# Altium schematic sheet Motor1.SchDoc
size A4; SheetNumber: 5; SheetTotal: 6
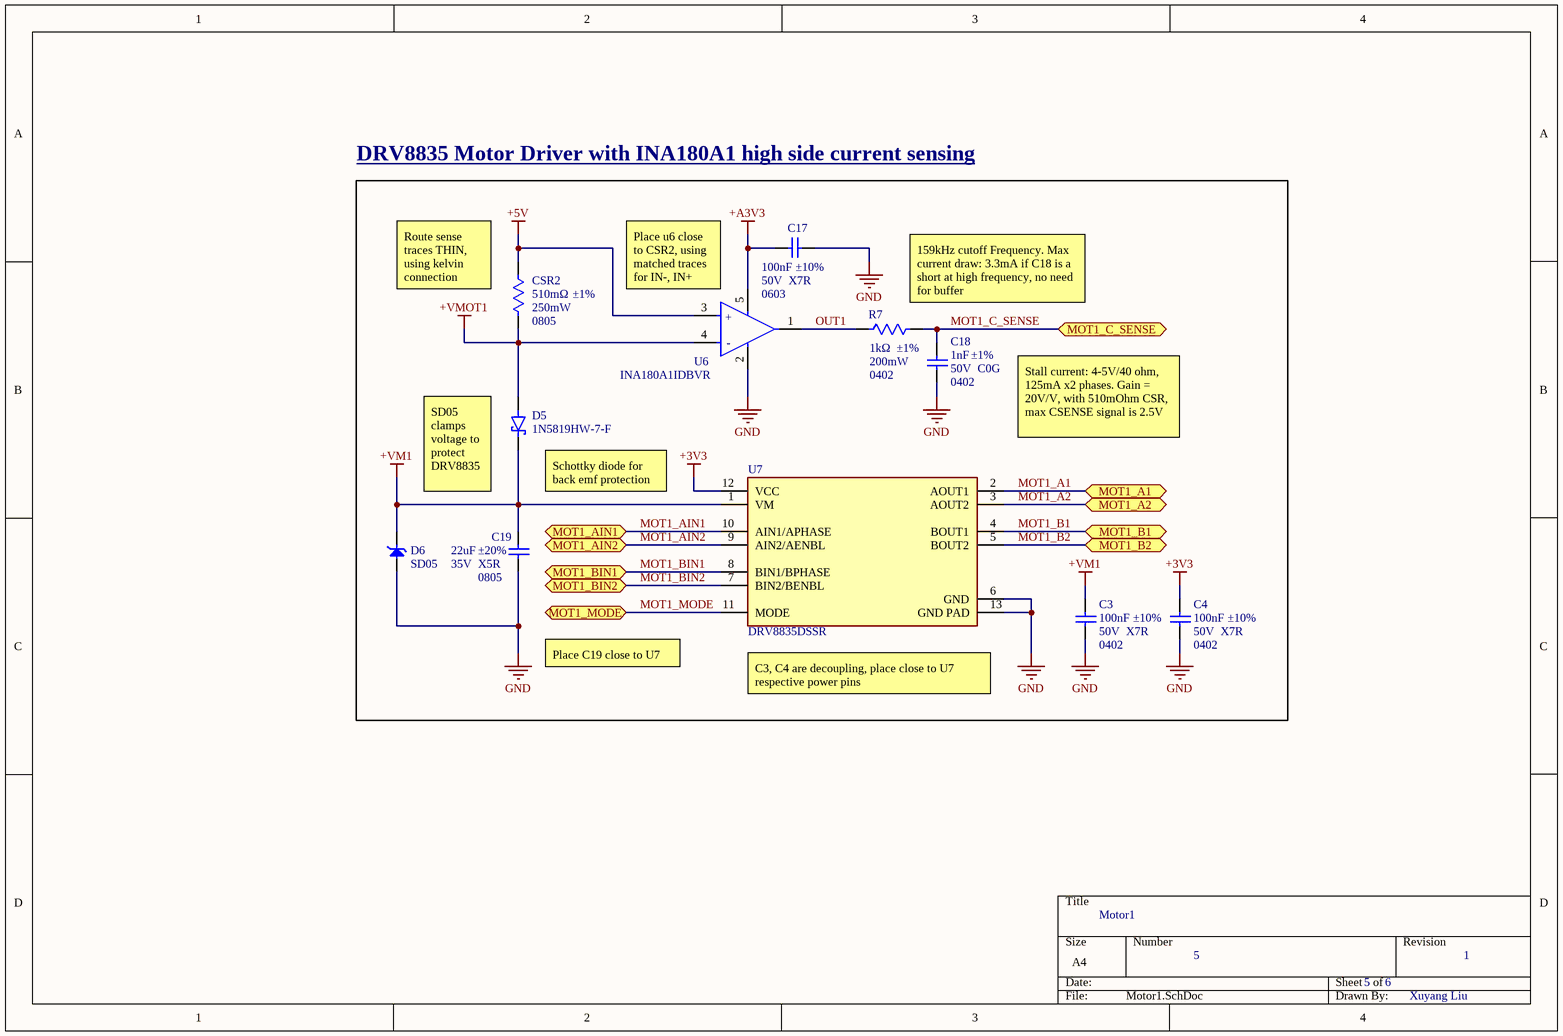
[diagram p0: Motor1.SchDoc]

## Parts
C3  Case/Package: 0402  Voltage Rating: 50V  Dielectric: X7R  Tolerance: ±10%  [0402_Cap]  (hidden comment: 100nF)
C4  Case/Package: 0402  Voltage Rating: 50V  Dielectric: X7R  Tolerance: ±10%  [0402_Cap]  (hidden comment: 100nF)
C17  Voltage Rating: 50V  Tolerance: ±10%  Dielectric: X7R  Case/Package: 0603  [0603_CAP]  (hidden comment: 100nF)
C18  Tolerance: ±1%  Voltage Rating: 50V  Dielectric: C0G  Case/Package: 0402  [0402_Cap]  (hidden comment: 1nF)
C19  22uF  Dielectric: X5R  Case/Package: 0805  Tolerance: ±20%  Voltage Rating: 35V  [0805_CAP]
CSR2  Case/Package: 0805  Tolerance: ±1%  Resistance: 510mΩ  Power Rating: 250mW  [0805_VIS-M]  (hidden comment: 0.5R)
D5  1N5819HW-7-F  [FP-SOD123-MFG]
D6  SD05  [DIO_MM3Z3V0T1G]
R7  Power Rating: 200mW  Tolerance: ±1%  Case/Package: 0402  Resistance: 1kΩ  [0402_RES]  (hidden comment: 1K)
U6  INA180A1IDBVR  [FP-DBV0005A-MFG]
U7  DRV8835DSSR  [FP-DSS0012A-MFG]

## Blocks framed on the sheet
DRV8835 Motor Driver with INA180A1 high side current sensing: C3 C4 C17-C19 CSR2 D5 D6 R7 U6 U7

## Ports
MOT1_A1 (bidir), MOT1_A2 (bidir), MOT1_AIN1 (bidir), MOT1_AIN2 (bidir), MOT1_B1 (bidir), MOT1_B2 (bidir), MOT1_BIN1 (bidir), MOT1_BIN2 (bidir), MOT1_C_SENSE (bidir), MOT1_MODE (bidir)

## Nets
+3V3: C4.2 U7.12(VCC)
+5V: CSR2.2 U6.3(IN+)
+A3V3: C17.2 U6.5(VS)
+VM1: C3.2 C19.2 D5.C D6.K U7.1(VM)
+VMOT1: CSR2.1 D5.A U6.4(IN-)
GND: C3.1 C4.1 C17.1 C18.1 C19.1 D6.A U6.2(GND) U7.6(GND) U7.13(GND_PAD)
MOT1_A1: U7.2(AOUT1) ; port MOT1_A1
MOT1_A2: U7.3(AOUT2) ; port MOT1_A2
MOT1_AIN1: U7.10(AIN1/APHASE) ; port MOT1_AIN1
MOT1_AIN2: U7.9(AIN2/AENBL) ; port MOT1_AIN2
MOT1_B1: U7.4(BOUT1) ; port MOT1_B1
MOT1_B2: U7.5(BOUT2) ; port MOT1_B2
MOT1_BIN1: U7.8(BIN1/BPHASE) ; port MOT1_BIN1
MOT1_BIN2: U7.7(BIN2/BENBL) ; port MOT1_BIN2
MOT1_C_SENSE: C18.2 R7.2 ; port MOT1_C_SENSE
MOT1_MODE: U7.11(MODE) ; port MOT1_MODE
OUT1: R7.1 U6.1(OUT)

## Notes on the sheet
- (near CSR2) Route sense traces THIN, using kelvin connection
- (near U6) Place u6 close to CSR2, using matched traces for IN-, IN+
- (near R7) 159kHz cutoff Frequency. Max current draw: 3.3mA if C18 is a short at high frequency, no need for buffer
- Stall current: 4-5V/40 ohm, 125mA x2 phases. Gain = 20V/V, with 510mOhm CSR, max CSENSE signal is 2.5V
- (near D5) SD05 clamps voltage to protect DRV8835
- (near D5) Schottky diode for back emf protection
- Place C19 close to U7
- (near U7) C3, C4 are decoupling, place close to U7 respective power pins
- Motor1
- 5
- 5     6
- 1
- Xuyang Liu
- (in symbol INA180A1IDBVR) +; -

## Library data of the parts
C3 C4 = GCM155R71H104KE02J: 50V 100nF X7R ±10% 0402 Multilayer Ceramic Capacitors MLCC - SMD/SMT ROHS; Manufacturer: Murata; Manufacturer Lifecycle Status: IN PRODUCTION; Supplier 1: DigiKey; Manufacturer Part Number: GCM155R71H104KE02J; RoHS: Compliant; Category: Ceramic Capacitors; Stock 1: 13930662; Pricing 1: 1=0.1, 10=0.034, 50=0.0226, 100=0.0193, 500=0.01374, 1000=0.01205, 2500=0.01027, 5000=0.0092 (USD); Case Code (Imperial): 0402; Case Code (Metric): 1005; Country of Origin: Philippines; Dielectric Material: Ceramic; Export Control Classification Number (ECCN) Code: EAR99; Height: 500µm; Harmonized Tariff Schedule (HTS) Code: 8532.24.00.20; Introduction Date: 2013-11-20; Length: 1mm; Lifecycle Status: Production; Material: Ceramic; Max Operating Temperature: 125°C; Min Operating Temperature: -55°C; Mount: Surface Mount; Number of Terminals: 2; Packaging: Tape & Reel (TR); Ratings: AEC-Q200; REACH SVHC: Yes; Schedule B: 8532240020, 8532240020|8532240020, 8532240020|8532240020|8532240020, 8532240020|8532240020|8532240020|8532240020; Termination: SMD/SMT; Voltage Rating (DC): 50V; Weight: 6.010099mg; Width: 500µm; ComponentLink1URL: https://datasheet.octopart.com:443/GCM155R71H104KE02J-Murata-datasheet-155345015.pdf?src-supplier=Newark; ComponentLink1Description: https://datasheet.octopart.com:443/GCM155R71H104KE02J-Murata-datasheet-155345015.pdf?src-supplier=Newark; ComponentLink2URL: https://datasheet.octopart.com:443/GCM155R71H104KE02J-Murata-datasheet-178519985.pdf?src-supplier=Arrow.cn; ComponentLink2Description: https://datasheet.octopart.com:443/GCM155R71H104KE02J-Murata-datasheet-178519985.pdf?src-supplier=Arrow.cn; ComponentLink3URL: https://datasheet.octopart.com:443/GCM155R71H104KE02J-Murata-datasheet-141266224.pdf?src-supplier=Ciiva; ComponentLink3Description: https://datasheet.octopart.com:443/GCM155R71H104KE02J-Murata-datasheet-141266224.pdf?src-supplier=Ciiva; ComponentLink4URL: https://datasheet.octopart.com:443/GCM155R71H104KE02J-Murata-datasheet-140656751.pdf?src-supplier=Ciiva; ComponentLink4Description: https://datasheet.octopart.com:443/GCM155R71H104KE02J-Murata-datasheet-140656751.pdf?src-supplier=Ciiva; ComponentLink5URL: https://datasheet.octopart.com:443/GCM155R71H104KE02J-Murata-datasheet-138716456.pdf?src-supplier=Ciiva; ComponentLink5Description: https://datasheet.octopart.com:443/GCM155R71H104KE02J-Murata-datasheet-138716456.pdf?src-supplier=Ciiva; ComponentLink6URL: https://datasheet.octopart.com:443/GCM155R71H104KE02J-Murata-datasheet-77992203.pdf?src-supplier=Future+Electronics; ComponentLink6Description: https://datasheet.octopart.com:443/GCM155R71H104KE02J-Murata-datasheet-77992203.pdf?src-supplier=Future+Electronics; ComponentLink7URL: https://datasheet.octopart.com:443/GCM155R71H104KE02J-Murata-datasheet-12511495.pdf?src-supplier=TME; ComponentLink7Description: https://datasheet.octopart.com:443/GCM155R71H104KE02J-Murata-datasheet-12511495.pdf?src-supplier=TME; ComponentLink8URL: http://sigma.octopart.com:80/reach_statement/Murata-company-16.pdf?src-supplier=Compliance+Statements; ComponentLink8Description: http://sigma.octopart.com:80/reach_statement/Murata-company-16.pdf?src-supplier=Compliance+Statements; Supplier Part Number 1: 490-14514-6-ND; Capacitance: 100nF
C17 = GCJ188R71H104KA12D: 50V 100nF X7R ±10% 0603 Multilayer Ceramic Capacitors MLCC - SMD/SMT ROHS; Manufacturer: Murata; Manufacturer Lifecycle Status: IN PRODUCTION; Manufacturer Part Number: GCJ188R71H104KA12D; RoHS: Compliant; Category: Ceramic Capacitors; Stock 1: 938408; Pricing 1: 1=0.13, 10=0.073, 50=0.0508, 100=0.044, 500=0.0327, 1000=0.02922 (USD); Case Code (Imperial): 0603; Case Code (Metric): 1608; Country of Origin: Japan, Philippines; Depth: 800µm; Dielectric Material: Ceramic; Export Control Classification Number (ECCN) Code: EAR99; Features: Soft Termination; Height: 800µm; Harmonized Tariff Schedule (HTS) Code: 8532.24.00.20; Introduction Date: 2012-05-07; Lead Free: Lead Free; Length: 1.6mm; Lifecycle Status: Production; Material: Ceramic; Max Operating Temperature: 125°C; Min Operating Temperature: -55°C; Mount: Surface Mount; Number of Terminals: 2; Packaging: Cut Tape; Radiation Hardening: No; Ratings: AEC-Q200; REACH SVHC: Yes; Schedule B: 8532240020, 8532240020|8532240020, 8532240020|8532240020|8532240020, 8532240020|8532240020|8532240020|8532240020; Termination: SMD/SMT; Voltage Rating (DC): 50V; Width: 800µm; ComponentLink1URL: https://datasheet.octopart.com:443/GCJ188R71H104KA12D-Murata-datasheet-68586835.pdf?src-supplier=Newark; ComponentLink1Description: https://datasheet.octopart.com:443/GCJ188R71H104KA12D-Murata-datasheet-68586835.pdf?src-supplier=Newark; ComponentLink2URL: https://datasheet.octopart.com:443/GCJ188R71H104KA12D-Murata-datasheet-140654765.pdf?src-supplier=Ciiva; ComponentLink2Description: https://datasheet.octopart.com:443/GCJ188R71H104KA12D-Murata-datasheet-140654765.pdf?src-supplier=Ciiva; ComponentLink3URL: https://datasheet.octopart.com:443/GCJ188R71H104KA12D-Murata-datasheet-138714437.pdf?src-supplier=Ciiva; ComponentLink3Description: https://datasheet.octopart.com:443/GCJ188R71H104KA12D-Murata-datasheet-138714437.pdf?src-supplier=Ciiva; ComponentLink4URL: https://datasheet.octopart.com:443/GCJ188R71H104KA12D-Murata-datasheet-165611796.pdf?src-supplier=TME; ComponentLink4Description: https://datasheet.octopart.com:443/GCJ188R71H104KA12D-Murata-datasheet-165611796.pdf?src-supplier=TME; ComponentLink5URL: https://datasheet.octopart.com:443/GCJ188R71H104KA12D-Murata-datasheet-12524712.pdf?src-supplier=Future+Electronics; ComponentLink5Description: https://datasheet.octopart.com:443/GCJ188R71H104KA12D-Murata-datasheet-12524712.pdf?src-supplier=Future+Electronics; ComponentLink6URL: https://datasheet.octopart.com/GCJ188R71H104KA12D-Murata-datasheet-14405607.pdf; ComponentLink6Description: https://datasheet.octopart.com/GCJ188R71H104KA12D-Murata-datasheet-14405607.pdf; ComponentLink7URL: http://sigma.octopart.com:80/reach_statement/Murata-company-16.pdf?src-supplier=Compliance+Statements; ComponentLink7Description: http://sigma.octopart.com:80/reach_statement/Murata-company-16.pdf?src-supplier=Compliance+Statements; Supplier 1: DigiKey; Supplier Part Number 1: 490-5798-1-ND; Capacitance: 100nF
C18 = GCM1555C1H102FA16D: 50V 1nF C0G ±1% 0402 Multilayer Ceramic Capacitors MLCC - SMD/SMT ROHS; Manufacturer: Murata; Manufacturer Lifecycle Status: IN PRODUCTION; Temperature Coefficient: 30ppm/°C; Supplier 1: DigiKey; Manufacturer Part Number: GCM1555C1H102FA16D; RoHS: Compliant; Category: Ceramic Capacitors; Stock 1: 471842; Pricing 1: 1=0.11, 10=0.06, 50=0.0416, 100=0.036, 500=0.02644, 1000=0.02351, 2500=0.02044, 5000=0.01859 (USD); Dielectric Material: Ceramic; Export Control Classification Number (ECCN) Code: EAR99; Height: 500µm; Harmonized Tariff Schedule (HTS) Code: 8532.24.00.20; Introduction Date: 2017-02-15; Length: 1mm; Lifecycle Status: Production; Material: Ceramic; Max Operating Temperature: 125°C; Min Operating Temperature: -55°C; Mount: Surface Mount; Number of Terminals: 2; Ratings: AEC-Q200; REACH SVHC: Yes; Schedule B: 8532240020, 8532240020|8532240020|8532240020|8532240020|8532240020; Thickness: 500µm; Voltage Rating (DC): 50V; Width: 500µm; ComponentLink1URL: https://datasheet.octopart.com:443/GCM1555C1H102FA16D-Murata-datasheet-149522306.pdf?src-supplier=Newark; ComponentLink1Description: https://datasheet.octopart.com:443/GCM1555C1H102FA16D-Murata-datasheet-149522306.pdf?src-supplier=Newark; ComponentLink2URL: https://datasheet.octopart.com:443/GCM1555C1H102FA16D-Murata-datasheet-141265810.pdf?src-supplier=Geoflip; ComponentLink2Description: https://datasheet.octopart.com:443/GCM1555C1H102FA16D-Murata-datasheet-141265810.pdf?src-supplier=Geoflip; ComponentLink3URL: https://datasheet.octopart.com:443/GCM1555C1H102FA16D-Murata-datasheet-140655917.pdf?src-supplier=Ciiva; ComponentLink3Description: https://datasheet.octopart.com:443/GCM1555C1H102FA16D-Murata-datasheet-140655917.pdf?src-supplier=Ciiva; ComponentLink4URL: https://datasheet.octopart.com:443/GCM1555C1H102FA16D-Murata-datasheet-138715608.pdf?src-supplier=Ciiva; ComponentLink4Description: https://datasheet.octopart.com:443/GCM1555C1H102FA16D-Murata-datasheet-138715608.pdf?src-supplier=Ciiva; ComponentLink5URL: https://datasheet.octopart.com:443/GCM1555C1H102FA16D-Murata-datasheet-12511495.pdf?src-supplier=TME; ComponentLink5Description: https://datasheet.octopart.com:443/GCM1555C1H102FA16D-Murata-datasheet-12511495.pdf?src-supplier=TME; ComponentLink6URL: http://sigma.octopart.com:80/reach_statement/Murata-company-16.pdf?src-supplier=Compliance+Statements; ComponentLink6Description: http://sigma.octopart.com:80/reach_statement/Murata-company-16.pdf?src-supplier=Compliance+Statements; Supplier Part Number 1: 490-16461-1-ND; Capacitance: 1nF
C19 = GMC21X5R226M35NT: 35V 22uF Ceramic Capacitor, Multilayer, Ceramic, 35V, 20% +Tol, 20% -Tol, X5R, 15% TC, 22uF, Surface Mount, 0805; Manufacturer: Cal-Chip Electronics; Capacitance: 22µF; Supplier 1: DigiKey; Manufacturer Part Number: GMC21X5R226M35NT; RoHS: Compliant; Category: Ceramic Capacitors; Stock 1: 120000; Pricing 1: 2000=0.22286, 4000=0.21143, 6000=0.20571, 10000=0.19936, 14000=0.19565, 20000=0.19208 (USD); China RoHS: Compliant; Country of Origin: Slovenia, South Korea, Taiwan; Dielectric Material: Ceramic; Export Control Classification Number (ECCN) Code: EAR99; Height: 1.45mm; Harmonized Tariff Schedule (HTS) Code: 8532.24.00.20; Introduction Date: 2021-04-21; Length: 2mm; Lifecycle Status: Production; Material: Ceramic; Max Operating Temperature: 85°C; Min Operating Temperature: -55°C; Mount: Surface Mount; Number of Terminals: 2; REACH SVHC: Yes; Voltage Rating (DC): 35V; Width: 1.25mm; ComponentLink1URL: https://datasheet.octopart.com:443/GMC21X5R226M35NT-Cal-Chip-Electronics-datasheet-182028815.pdf?src-supplier=IHS; ComponentLink1Description: https://datasheet.octopart.com:443/GMC21X5R226M35NT-Cal-Chip-Electronics-datasheet-182028815.pdf?src-supplier=IHS; Supplier Part Number 1: 4713-GMC21X5R226M35NTTR-ND
CSR2 = RCWE0805R510FKEA: SMD Current Sense Resistors, AEC-Q200 RCWE Series, 0.51 ohm, 250 mW, - 1%; Manufacturer: Vishay; Manufacturer Package Identifier: 0805 (2012 metric); Temperature Coefficient: 100ppm/°C; Working Voltage: 357.1mV; Supplier 1: DigiKey; Manufacturer Part Number: RCWE0805R510FKEA; RoHS: Compliant; Category: Chip SMD Resistors; Stock 1: 54161; Pricing 1: 1=0.17, 10=0.111, 25=0.0928, 50=0.0818, 100=0.0724, 250=0.06208, 500=0.0556, 1000=0.05009 (USD); Case Code (Imperial): 0805; Case Code (Metric): 2012; China RoHS: Non-Compliant; Composition: Thick Film; Contact Plating: Tin; Export Control Classification Number (ECCN) Code: EAR99; Features: Automotive AEC-Q200, Moisture Resistant; Height: 550µm; Harmonized Tariff Schedule (HTS) Code: 8533.21.00.30; Introduction Date: 2010-07-14; Length: 2mm; Lifecycle Status: Production; Max Operating Temperature: 155°C; Max Power Dissipation: 250mW; Min Operating Temperature: -55°C; Mount: Surface Mount; Number of Pins: 2; Number of Terminals: 2; Number of Terminations: 2; Radiation Hardening: No; Ratings: AEC-Q200; REACH SVHC: Yes; Schedule B: 8533210045, 8533210045|8533210045|8533210045|8533210045|8533210045; Termination: SMD/SMT; Width: 1.3mm; ComponentLink1URL: https://datasheet.octopart.com:443/RCWE0805R510FKEA-Vishay-datasheet-170667730.pdf?src-supplier=IHS; ComponentLink1Description: https://datasheet.octopart.com:443/RCWE0805R510FKEA-Vishay-datasheet-170667730.pdf?src-supplier=IHS; ComponentLink2URL: https://datasheet.octopart.com:443/RCWE0805R510FKEA-Vishay-datasheet-102324946.pdf?src-supplier=Farnell; ComponentLink2Description: https://datasheet.octopart.com:443/RCWE0805R510FKEA-Vishay-datasheet-102324946.pdf?src-supplier=Farnell; ComponentLink3URL: https://datasheet.octopart.com:443/RCWE0805R510FKEA-Vishay-datasheet-78835242.pdf?src-supplier=Newark; ComponentLink3Description: https://datasheet.octopart.com:443/RCWE0805R510FKEA-Vishay-datasheet-78835242.pdf?src-supplier=Newark; ComponentLink4URL: https://datasheet.octopart.com:443/RCWE0805R510FKEA-Vishay-datasheet-10025643.pdf?src-supplier=element14+APAC; ComponentLink4Description: https://datasheet.octopart.com:443/RCWE0805R510FKEA-Vishay-datasheet-10025643.pdf?src-supplier=element14+APAC; ComponentLink5URL: https://datasheet.octopart.com:443/RCWE0805R510FKEA-Vishay-datasheet-13263558.pdf?src-supplier=Future+Electronics; ComponentLink5Description: https://datasheet.octopart.com:443/RCWE0805R510FKEA-Vishay-datasheet-13263558.pdf?src-supplier=Future+Electronics; ComponentLink6URL: https://datasheet.octopart.com:443/RCWE0805R510FKEA-Vishay-datasheet-13248156.pdf?src-supplier=Future+Electronics; ComponentLink6Description: https://datasheet.octopart.com:443/RCWE0805R510FKEA-Vishay-datasheet-13248156.pdf?src-supplier=Future+Electronics; ComponentLink7URL: https://datasheet.octopart.com:443/RCWE0805R510FKEA-Vishay-datasheet-12556293.pdf?src-supplier=Future+Electronics; ComponentLink7Description: https://datasheet.octopart.com:443/RCWE0805R510FKEA-Vishay-datasheet-12556293.pdf?src-supplier=Future+Electronics; ComponentLink8URL: https://datasheet.octopart.com:443/RCWE0805R510FKEA-Vishay-datasheet-12513971.pdf?src-supplier=Future+Electronics; ComponentLink8Description: https://datasheet.octopart.com:443/RCWE0805R510FKEA-Vishay-datasheet-12513971.pdf?src-supplier=Future+Electronics; ComponentLink9URL: http://sigma.octopart.com:80/rohs_statement/Vishay-company-15.pdf?src-supplier=Compliance+Statements; ComponentLink9Description: http://sigma.octopart.com:80/rohs_statement/Vishay-company-15.pdf?src-supplier=Compliance+Statements; Supplier Part Number 1: RCWE.51DCT-ND
D5 = 1N5819HW-7-F: 1N5819HW Series 40 V 1 A Surface Mount Schottky Barrier Rectifier - SOD-123; Manufacturer: Diodes Inc.; Average Rectified Current: 1A; Capacitance: 50pF; Element Configuration: Single; Forward Voltage: 750mV; Max Forward Surge Current (Ifsm): 25A; Max Junction Temperature (Tj): 125°C; Max Power Dissipation: 450mW; Max Repetitive Reverse Voltage (Vrrm): 40V; Number of Elements: 1; Peak Reverse Current: 1mA; Polarity: Standard; Supplier 1: DigiKey; Manufacturer Part Number: 1N5819HW-7-F; RoHS: Compliant; Category: Schottky Diodes; Stock 1: 1016143; Pricing 1: 1=0.29, 10=0.178, 100=0.1108, 500=0.08152, 1000=0.07202 (USD); Case/Package: SOD-123-2; China RoHS: Compliant; Contact Plating: Tin; Current Rating: 1A; Forward Current: 1A; Height: 1.45mm; Lead Free: Lead Free; Length: 2.85mm; Lifecycle Status: Production; Max Operating Temperature: 125°C; Max Output Current: 1A; Max Reverse Voltage (DC): 40V; Min Breakdown Voltage: 40V; Min Operating Temperature: -65°C; Number of Pins: 2; Number of Terminals: 2; Output Current: 1A; Packaging: Tape and Reel; Peak Non-Repetitive Surge Current: 25A; Radiation Hardening: No; REACH SVHC: Yes; Reverse Standoff Voltage: 40V; Reverse Voltage: 40V; Schedule B: 8541100080, 8541100080|8541100080|8541100080|8541100080|8541100080; Termination: SMD/SMT; Voltage Rating (DC): 40V; Weight: 10.007382mg; Width: 1.7mm; ComponentLink1URL: https://datasheet.octopart.com:443/1N5819HW-7-F-Diodes-Inc.-datasheet-180549196.pdf?src-supplier=IHS; ComponentLink1Description: https://datasheet.octopart.com:443/1N5819HW-7-F-Diodes-Inc.-datasheet-180549196.pdf?src-supplier=IHS; ComponentLink2URL: https://datasheet.octopart.com:443/1N5819HW-7-F-Diodes-Inc.-datasheet-8332965.pdf?src-supplier=Upverter; ComponentLink2Description: https://datasheet.octopart.com:443/1N5819HW-7-F-Diodes-Inc.-datasheet-8332965.pdf?src-supplier=Upverter; ComponentLink3URL: https://sigma.octopart.com:443/138895985/technical_drawing/Diodes-Inc.-1N5819HW-7-F.pdf?src-supplier=Upverter; ComponentLink3Description: https://sigma.octopart.com:443/138895985/technical_drawing/Diodes-Inc.-1N5819HW-7-F.pdf?src-supplier=Upverter; ComponentLink4URL: https://datasheet.octopart.com:443/1N5819HW-7-F-Diodes-Inc.-datasheet-134530231.pdf?src-supplier=Future+Electronics; ComponentLink4Description: https://datasheet.octopart.com:443/1N5819HW-7-F-Diodes-Inc.-datasheet-134530231.pdf?src-supplier=Future+Electronics; ComponentLink5URL: https://datasheet.octopart.com:443/1N5819HW-7-F-Diodes-Inc.-datasheet-34441420.pdf?src-supplier=Future+Electronics; ComponentLink5Description: https://datasheet.octopart.com:443/1N5819HW-7-F-Diodes-Inc.-datasheet-34441420.pdf?src-supplier=Future+Electronics; ComponentLink6URL: https://datasheet.octopart.com:443/1N5819HW-7-F-Diodes-Inc.-datasheet-10497210.pdf?src-supplier=Future+Electronics; ComponentLink6Description: https://datasheet.octopart.com:443/1N5819HW-7-F-Diodes-Inc.-datasheet-10497210.pdf?src-supplier=Future+Electronics; ComponentLink7URL: https://datasheet.octopart.com:443/1N5819HW-7-F-Diodes-Inc.-datasheet-169364014.pdf?src-supplier=Newark; ComponentLink7Description: https://datasheet.octopart.com:443/1N5819HW-7-F-Diodes-Inc.-datasheet-169364014.pdf?src-supplier=Newark; ComponentLink8URL: https://datasheet.octopart.com:443/1N5819HW-7-F-Diodes-Inc.-datasheet-78715396.pdf?src-supplier=Newark; ComponentLink8Description: https://datasheet.octopart.com:443/1N5819HW-7-F-Diodes-Inc.-datasheet-78715396.pdf?src-supplier=Newark; ComponentLink9URL: https://datasheet.octopart.com:443/1N5819HW-7-F-Diodes-Inc.-datasheet-14053419.pdf?src-supplier=iiiC; ComponentLink9Description: https://datasheet.octopart.com:443/1N5819HW-7-F-Diodes-Inc.-datasheet-14053419.pdf?src-supplier=iiiC; ComponentLink10URL: https://datasheet.octopart.com:443/1N5819HW-7-F-Diodes-Inc.-datasheet-7274306.pdf?src-supplier=Jameco+(USA); ComponentLink10Description: https://datasheet.octopart.com:443/1N5819HW-7-F-Diodes-Inc.-datasheet-7274306.pdf?src-supplier=Jameco+(USA); ComponentLink11URL: https://datasheet.octopart.com:443/1N5819HW-7-F-Diodes-Inc.-datasheet-16627.pdf?src-supplier=Mouser; ComponentLink11Description: https://datasheet.octopart.com:443/1N5819HW-7-F-Diodes-Inc.-datasheet-16627.pdf?src-supplier=Mouser; ComponentLink12URL: https://datasheet.octopart.com:443/1N5819HW-7-F-Diodes-Inc.-datasheet-145195.pdf?src-supplier=DigiKey; ComponentLink12Description: https://datasheet.octopart.com:443/1N5819HW-7-F-Diodes-Inc.-datasheet-145195.pdf?src-supplier=DigiKey; ComponentLink13URL: http://sigma.octopart.com:80/15616867/materials_sheet/Diodes-Inc.-1N5819HW-7-F.pdf?src-supplier=Compliance+Statements; ComponentLink13Description: http://sigma.octopart.com:80/15616867/materials_sheet/Diodes-Inc.-1N5819HW-7-F.pdf?src-supplier=Compliance+Statements; Supplier Part Number 1: 1N5819HW-FDICT-ND
D6 = SD05: Trans Voltage Suppressor Diode, 350W, 5V V(RWM), Unidirectional, 1 Element, Silicon; Manufacturer: Sangdest Microelectronics; Clamping Voltage: 14.5V; Min Breakdown Voltage: 6V; Number of Elements: 1; Peak Reverse Current: 10µA; Supplier 1: DigiKey; Manufacturer Part Number: SD05; RoHS: Compliant; Category: TVS Diodes; Stock 1: 13210; Pricing 1: 1=0.27, 10=0.165, 100=0.1025, 500=0.0752, 1000=0.06636 (USD); Lifecycle Status: Production; Max Operating Temperature: 125°C; Min Operating Temperature: -55°C; Number of Terminals: 2; Peak Pulse Power: 350W; Polarity: Unidirectional; REACH SVHC: Yes; Reverse Standoff Voltage: 5V; ComponentLink1URL: https://datasheet.octopart.com:443/SD05-SMC-Diode-Solutions-datasheet-181400473.pdf?src-supplier=IHS; ComponentLink1Description: https://datasheet.octopart.com:443/SD05-SMC-Diode-Solutions-datasheet-181400473.pdf?src-supplier=IHS; Supplier Part Number 1: 1655-SD05CT-ND
R7 = RCA04021K00FKEDHP: 1kΩ SMD Chip Resistor, 1 kOhm, ± 1%, 200 mW, 0402 [1005 Metric], Thick Film, Anti-Sulfur High Power; Manufacturer: Vishay; Temperature Coefficient: 100ppm/°C; Working Voltage: 50V; Supplier 1: DigiKey; Manufacturer Part Number: RCA04021K00FKEDHP; RoHS: Compliant; Category: Chip SMD Resistors; Stock 1: 9610; Pricing 1: 1=0.1, 10=0.049, 25=0.0456, 50=0.043, 100=0.0407, 250=0.03772, 500=0.03566, 1000=0.03376, 5000=0.02999 (USD); Country of Origin: Israel; Export Control Classification Number (ECCN) Code: EAR99; Height: 300µm; Harmonized Tariff Schedule (HTS) Code: 8533.21.00.30; Introduction Date: 2016-09-25; Length: 1mm; Lifecycle Status: Production; Max Operating Temperature: 155°C; Min Operating Temperature: -55°C; Mount: Surface Mount; Number of Terminals: 2; Ratings: AEC-Q200; REACH SVHC: Yes; Width: 500µm; ComponentLink1URL: https://datasheet.octopart.com:443/RCA04021K00FKEDHP-Vishay-datasheet-182028367.pdf?src-supplier=IHS; ComponentLink1Description: https://datasheet.octopart.com:443/RCA04021K00FKEDHP-Vishay-datasheet-182028367.pdf?src-supplier=IHS; ComponentLink2URL: http://sigma.octopart.com:80/rohs_statement/Vishay-company-15.pdf?src-supplier=Compliance+Statements; ComponentLink2Description: http://sigma.octopart.com:80/rohs_statement/Vishay-company-15.pdf?src-supplier=Compliance+Statements; Supplier Part Number 1: 541-3240-1-ND
U6 = INA180A1IDBVR: ROHS3Compliant e3 INA180 Matte Tin (Sn) op amp amplifier circuit 2.9mm 80muA 26V 350kHz; Manufacturer: Texas Instruments; Manufacturer Lifecycle Status: ACTIVE; Input Bias Current: 80µA; Input Offset Voltage (Vos): 100µV; Max Junction Temperature (Tj): 150°C; Max Supply Voltage: 5.5V; Min Supply Voltage: 2.7V; Nominal Supply Current: 197µA; Number of Channels: 1; Supplier 1: DigiKey; Manufacturer Part Number: INA180A1IDBVR; RoHS: Compliant; Category: Amplifiers - Op Amps, Buffer, Instrumentation; Pricing 1: 1=0.52, 10=0.363, 25=0.324, 100=0.2815, 250=0.26124, 500=0.24904, 1000=0.23899 (USD); Ambient Temperature Range High: 125°C; Bandwidth: 350kHz; Case/Package: SOT-23; Height: 1.45mm; Length: 2.9mm; Lifecycle Status: Production; Max Operating Temperature: 125°C; Min Operating Temperature: -40°C; Number of Pins: 5; Schedule B: 8542330000, 8542330000|8542330000|8542330000|8542330000|8542330000; Thickness: 1.2mm; Width: 1.6mm; ComponentLink1URL: https://sigma.octopart.com:443/177332311/technical_drawing/Texas-Instruments-INA180A1IDBVR.pdf?src-supplier=Texas+Instruments; ComponentLink1Description: https://sigma.octopart.com:443/177332311/technical_drawing/Texas-Instruments-INA180A1IDBVR.pdf?src-supplier=Texas+Instruments; ComponentLink2URL: https://octopart.com:443/opatz8j6/c1?t=USVpXwc3pIVbTVy8h6XuDkkoMGvkb5KD_FqeyE2PNCczB7YTe3Q13Z_T8ujtTn4Gpso-l7jh3l6VtA3vP-Hgq8a9n1cfIPRG-tpgt9UBcaQl0MK5o67hqvQcTaIDIYwSl7JEugdJq0jtVggrhuFBiiJJDgLUBw7G871SvT8UFaWvLuMV28-GBXdYGtfIxjjOnSlCpVbhUW_om3c_pXV3PX12KrIhnnIeCDjhaOM72OKUehH2shrJDmyrmRFLZA1ON-kpg-xfMekIeTPTZvu1kdk-ipxY04WCEpSq6AhyvyePoREOm4PqxzgZUX-SXQfHeLMqAZ0U-EEJvwubD6Cq1rmkHs9VIc9CN0w7gj8JD984MXRoqBAxtRGhZEIaf43rCiTHWg&src-supplier=Texas+Instruments; ComponentLink2Description: https://octopart.com:443/opatz8j6/c1?t=USVpXwc3pIVbTVy8h6XuDkkoMGvkb5KD_FqeyE2PNCczB7YTe3Q13Z_T8ujtTn4Gpso-l7jh3l6VtA3vP-Hgq8a9n1cfIPRG-tpgt9UBcaQl0MK5o67hqvQcTaIDIYwSl7JEugdJq0jtVggrhuFBiiJJDgLUBw7G871SvT8UFaWvLuMV28-GBXdYGtfIxjjOnSlCpVbhUW_om3c_pXV3PX12KrIhnnIeCDjhaOM72OKUehH2shrJDmyrmRFLZA1ON-kpg-xfMekIeTPTZvu1kdk-ipxY04WCEpSq6AhyvyePoREOm4PqxzgZUX-SXQfHeLMqAZ0U-EEJvwubD6Cq1rmkHs9VIc9CN0w7gj8JD984MXRoqBAxtRGhZEIaf43rCiTHWg&src-supplier=Texas+Instruments; ComponentLink3URL: https://sigma.octopart.com:443/175570406/technical_drawing/Texas-Instruments-INA180A1IDBVR.pdf?src-supplier=Texas+Instruments; ComponentLink3Description: https://sigma.octopart.com:443/175570406/technical_drawing/Texas-Instruments-INA180A1IDBVR.pdf?src-supplier=Texas+Instruments; ComponentLink4URL: https://sigma.octopart.com:443/169406034/technical_drawing/Texas-Instruments-INA180A1IDBVR.pdf?src-supplier=Texas+Instruments; ComponentLink4Description: https://sigma.octopart.com:443/169406034/technical_drawing/Texas-Instruments-INA180A1IDBVR.pdf?src-supplier=Texas+Instruments; ComponentLink5URL: https://sigma.octopart.com:443/155939316/technical_drawing/Texas-Instruments-INA180A1IDBVR.pdf?src-supplier=Texas+Instruments; ComponentLink5Description: https://sigma.octopart.com:443/155939316/technical_drawing/Texas-Instruments-INA180A1IDBVR.pdf?src-supplier=Texas+Instruments; ComponentLink6URL: https://sigma.octopart.com:443/102331370/technical_drawing/Texas-Instruments-INA180A1IDBVR.pdf?src-supplier=Texas+Instruments; ComponentLink6Description: https://sigma.octopart.com:443/102331370/technical_drawing/Texas-Instruments-INA180A1IDBVR.pdf?src-supplier=Texas+Instruments; ComponentLink7URL: https://sigma.octopart.com:443/49249325/technical_drawing/Texas-Instruments-INA180A1IDBVR.pdf?src-supplier=Texas+Instruments; ComponentLink7Description: https://sigma.octopart.com:443/49249325/technical_drawing/Texas-Instruments-INA180A1IDBVR.pdf?src-supplier=Texas+Instruments; ComponentLink8URL: https://datasheet.octopart.com:443/INA180A1IDBVR-Texas-Instruments-datasheet-147835637.pdf?src-supplier=SHENGYU+ELECTRONICS; ComponentLink8Description: https://datasheet.octopart.com:443/INA180A1IDBVR-Texas-Instruments-datasheet-147835637.pdf?src-supplier=SHENGYU+ELECTRONICS; ComponentLink9URL: https://datasheet.octopart.com:443/INA180A1IDBVR-Texas-Instruments-datasheet-159598194.pdf?src-supplier=LCSC; ComponentLink9Description: https://datasheet.octopart.com:443/INA180A1IDBVR-Texas-Instruments-datasheet-159598194.pdf?src-supplier=LCSC; ComponentLink10URL: https://datasheet.octopart.com:443/INA180A1IDBVR-Texas-Instruments-datasheet-159115053.pdf?src-supplier=LCSC; ComponentLink10Description: https://datasheet.octopart.com:443/INA180A1IDBVR-Texas-Instruments-datasheet-159115053.pdf?src-supplier=LCSC; ComponentLink11URL: http://sigma.octopart.com:80/reach_statement/Texas-Instruments-company-64.pdf?src-supplier=Compliance+Statements; ComponentLink11Description: http://sigma.octopart.com:80/reach_statement/Texas-Instruments-company-64.pdf?src-supplier=Compliance+Statements; ComponentLink12URL: http://sigma.octopart.com:80/conflict_mineral_statement/Texas-Instruments-company-63.pdf?src-supplier=Compliance+Statements; ComponentLink12Description: http://sigma.octopart.com:80/conflict_mineral_statement/Texas-Instruments-company-63.pdf?src-supplier=Compliance+Statements; Supplier Part Number 1: 296-47652-1-ND
U7 = DRV8835DSSR: 12-V, 1.5-A dual H-bridge motor driver 12-WSON -40 to 85; Manufacturer: Texas Instruments; Manufacturer Lifecycle Status: ACTIVE; Collector Emitter Voltage (VCEO): 11V; Drain to Source Resistance: 305mΩ; Interface: Parallel; Logic Function: AND; Max Collector Current: 1.5A; Max Junction Temperature (Tj): 150°C; Max Supply Voltage: 7V; Min Supply Voltage: 2V; Motor Type: Brushed; Nominal Supply Current: 450µA; Number of Outputs: 2; Switching Frequency: 250kHz; Supplier 1: DigiKey; Manufacturer Part Number: DRV8835DSSR; RoHS: Compliant; Category: Motor Drivers; Stock 1: 49571; Pricing 1: 1=2.19, 10=1.619, 25=1.476, 100=1.3189, 250=1.24396, 500=1.20412 (USD); Height: 800µm; Lead Free: Lead Free; Length: 2mm; Lifecycle Status: Production; Max Operating Temperature: 85°C; Min Operating Temperature: -40°C; Mount: Surface Mount; Number of Pins: 12; Operating Supply Current: 1.5A; Output Current: 1.5A; Output Voltage: 11V; Packaging: Cut Tape; Radiation Hardening: No; REACH SVHC: No; Schedule B: 8542390000, 8542390000|8542390000|8542390000|8542390000|8542390000; Thickness: 750µm; Width: 3mm; ComponentLink1URL: https://sigma.octopart.com:443/81678663/technical_drawing/Texas-Instruments-DRV8835DSSR.pdf?src-supplier=Texas+Instruments; ComponentLink1Description: https://sigma.octopart.com:443/81678663/technical_drawing/Texas-Instruments-DRV8835DSSR.pdf?src-supplier=Texas+Instruments; ComponentLink2URL: https://octopart.com:443/opatz8j6/c1?t=yYKeYF_qTZgJqykfbkIe-MyNo-awpiDwQJ1JpZHc4QQmRE2ALxlPI2F5HuxbvxDQJgOwt9AujW2Z3abA8YObzfh8IObdK5EIxXvX-S8nfL3vF03rQCSr4IhvPx36lTDUzRho3FSTerecEi6PUwZQAcfw4biX9dfhX4qJFG4-DvkdYyzF_AXHfcrjW8NYqjtFm1Ig3y5pJIb4XtmcjhG94Ou3GqVr8sF3hx5Ni2mUq8MJhRMvjbwS2P2fKQOZ0GhDVzPGf3Gk655UHMKd4eaVKvQsspbWj7NAZfnUy6KTI0iGS1VjwsOnAAAnyZzeHo6qjg_9VUaOVsM5A2TuwDIAEEDLISKE6EaKfj0-xcuZ4_eWrZcxUU_9i-up4dsoawxXY1pm7Q&src-supplier=Texas+Instruments; ComponentLink2Description: https://octopart.com:443/opatz8j6/c1?t=yYKeYF_qTZgJqykfbkIe-MyNo-awpiDwQJ1JpZHc4QQmRE2ALxlPI2F5HuxbvxDQJgOwt9AujW2Z3abA8YObzfh8IObdK5EIxXvX-S8nfL3vF03rQCSr4IhvPx36lTDUzRho3FSTerecEi6PUwZQAcfw4biX9dfhX4qJFG4-DvkdYyzF_AXHfcrjW8NYqjtFm1Ig3y5pJIb4XtmcjhG94Ou3GqVr8sF3hx5Ni2mUq8MJhRMvjbwS2P2fKQOZ0GhDVzPGf3Gk655UHMKd4eaVKvQsspbWj7NAZfnUy6KTI0iGS1VjwsOnAAAnyZzeHo6qjg_9VUaOVsM5A2TuwDIAEEDLISKE6EaKfj0-xcuZ4_eWrZcxUU_9i-up4dsoawxXY1pm7Q&src-supplier=Texas+Instruments; ComponentLink3URL: https://datasheet.octopart.com:443/DRV8835DSSR-Texas-Instruments-datasheet-15896035.pdf?src-supplier=Texas+Instruments; ComponentLink3Description: https://datasheet.octopart.com:443/DRV8835DSSR-Texas-Instruments-datasheet-15896035.pdf?src-supplier=Texas+Instruments; ComponentLink4URL: https://datasheet.octopart.com:443/DRV8835DSSR-Texas-Instruments-datasheet-10948952.pdf?src-supplier=Texas+Instruments; ComponentLink4Description: https://datasheet.octopart.com:443/DRV8835DSSR-Texas-Instruments-datasheet-10948952.pdf?src-supplier=Texas+Instruments; ComponentLink5URL: https://sigma.octopart.com:443/49250719/technical_drawing/Texas-Instruments-DRV8835DSSR.pdf?src-supplier=Texas+Instruments; ComponentLink5Description: https://sigma.octopart.com:443/49250719/technical_drawing/Texas-Instruments-DRV8835DSSR.pdf?src-supplier=Texas+Instruments; ComponentLink6URL: https://datasheet.octopart.com:443/DRV8835DSSR-Texas-Instruments-datasheet-21773231.pdf?src-supplier=element14+APAC; ComponentLink6Description: https://datasheet.octopart.com:443/DRV8835DSSR-Texas-Instruments-datasheet-21773231.pdf?src-supplier=element14+APAC; ComponentLink7URL: https://datasheet.octopart.com:443/DRV8835DSSR-Texas-Instruments-datasheet-17762361.pdf?src-supplier=element14+APAC; ComponentLink7Description: https://datasheet.octopart.com:443/DRV8835DSSR-Texas-Instruments-datasheet-17762361.pdf?src-supplier=element14+APAC; ComponentLink8URL: https://datasheet.octopart.com:443/DRV8835DSSR-Texas-Instruments-datasheet-11523579.pdf?src-supplier=Upverter; ComponentLink8Description: https://datasheet.octopart.com:443/DRV8835DSSR-Texas-Instruments-datasheet-11523579.pdf?src-supplier=Upverter; ComponentLink9URL: https://datasheet.octopart.com:443/DRV8835DSSR-Texas-Instruments-datasheet-102488860.pdf?src-supplier=Farnell; ComponentLink9Description: https://datasheet.octopart.com:443/DRV8835DSSR-Texas-Instruments-datasheet-102488860.pdf?src-supplier=Farnell; ComponentLink10URL: https://datasheet.octopart.com:443/DRV8835DSSR-Texas-Instruments-datasheet-165803887.pdf?src-supplier=LCSC; ComponentLink10Description: https://datasheet.octopart.com:443/DRV8835DSSR-Texas-Instruments-datasheet-165803887.pdf?src-supplier=LCSC; ComponentLink11URL: https://datasheet.octopart.com:443/DRV8835DSSR-Texas-Instruments-datasheet-159606066.pdf?src-supplier=LCSC; ComponentLink11Description: https://datasheet.octopart.com:443/DRV8835DSSR-Texas-Instruments-datasheet-159606066.pdf?src-supplier=LCSC; ComponentLink12URL: https://datasheet.octopart.com:443/DRV8835DSSR-Texas-Instruments-datasheet-164414299.pdf?src-supplier=SHENGYU+ELECTRONICS; ComponentLink12Description: https://datasheet.octopart.com:443/DRV8835DSSR-Texas-Instruments-datasheet-164414299.pdf?src-supplier=SHENGYU+ELECTRONICS; ComponentLink13URL: https://datasheet.octopart.com:443/DRV8835DSSR-Texas-Instruments-datasheet-62346020.pdf?src-supplier=Newark; ComponentLink13Description: https://datasheet.octopart.com:443/DRV8835DSSR-Texas-Instruments-datasheet-62346020.pdf?src-supplier=Newark; ComponentLink14URL: https://datasheet.octopart.com:443/DRV8835DSSR-Texas-Instruments-datasheet-179109355.pdf?src-supplier=Arrow.cn; ComponentLink14Description: https://datasheet.octopart.com:443/DRV8835DSSR-Texas-Instruments-datasheet-179109355.pdf?src-supplier=Arrow.cn; ComponentLink15URL: http://sigma.octopart.com:80/reach_statement/Texas-Instruments-company-64.pdf?src-supplier=Compliance+Statements; ComponentLink15Description: http://sigma.octopart.com:80/reach_statement/Texas-Instruments-company-64.pdf?src-supplier=Compliance+Statements; ComponentLink16URL: http://sigma.octopart.com:80/conflict_mineral_statement/Texas-Instruments-company-63.pdf?src-supplier=Compliance+Statements; ComponentLink16Description: http://sigma.octopart.com:80/conflict_mineral_statement/Texas-Instruments-company-63.pdf?src-supplier=Compliance+Statements; Supplier Part Number 1: 296-30391-1-ND